# Altium schematic sheet E-Fuse.SchDoc
size A; SheetNumber: 2; SheetTotal: 4
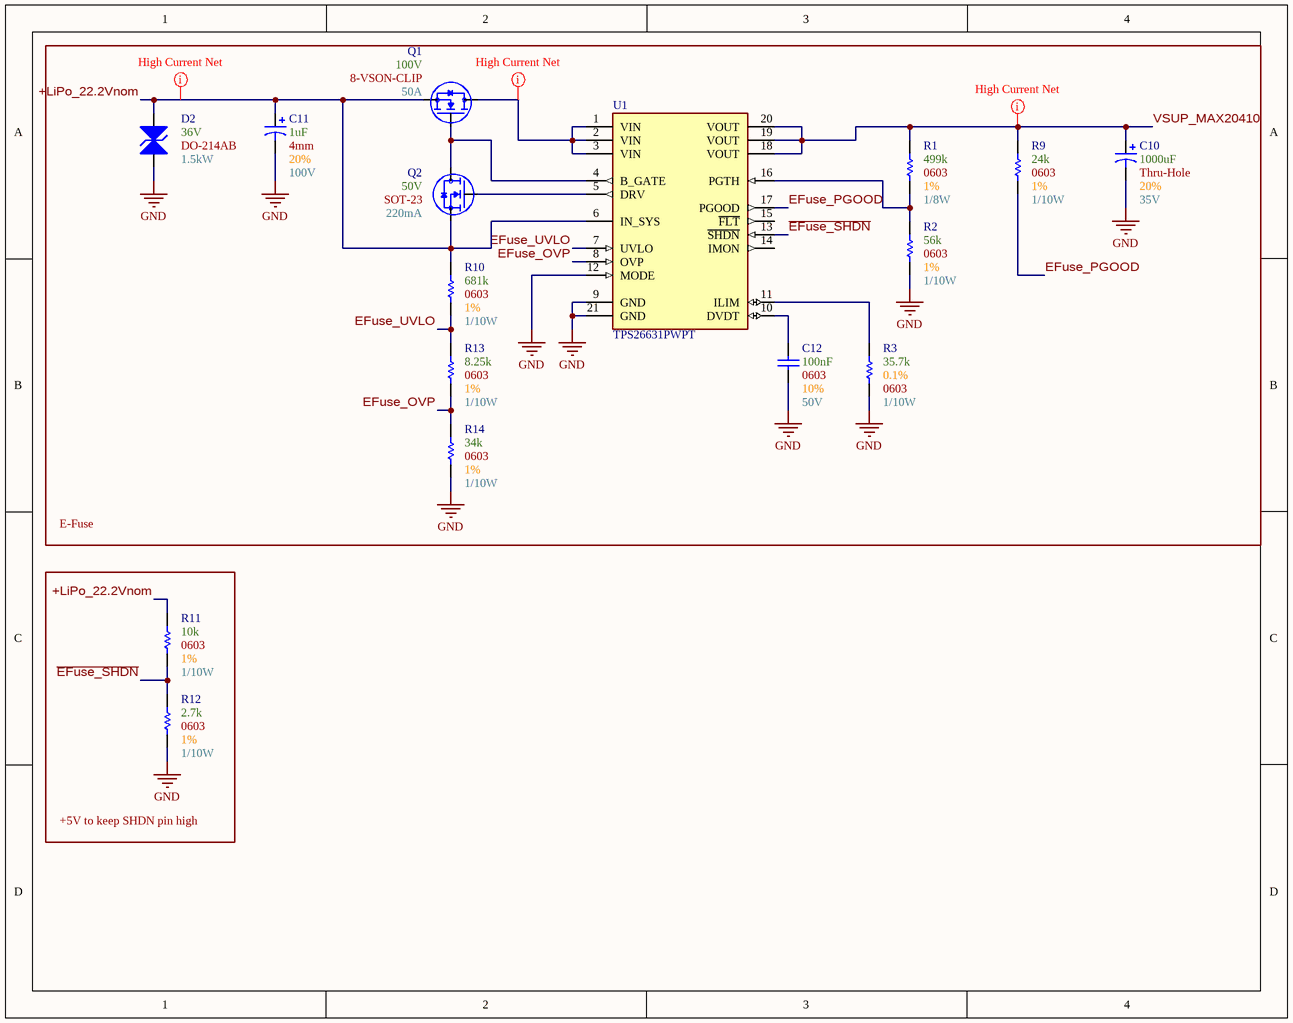
[diagram p0: E-Fuse.SchDoc]

## Parts
C10  Max Voltage: 35V  Size Package: Thru-Hole  Tolerance: 20%  Capacitance: 1000uF  [[Cap] Thru-Hole Polarized 10mm]  (hidden comment: [Cap] Thru-Hole 1000uF 20% 35V)
C11  Max Voltage: 100V  Size Package: 4mm  Tolerance: 20%  Capacitance: 1uF  [[Cap] SMD Polarized, 4mm]  (hidden comment: [Cap] 4mm 1uF 20% 100V)
C12  Max Voltage: 50V  Size Package: 0603  Tolerance: 10%  Capacitance: 100nF  [[Cap] SMD 0603]  (hidden comment: [Cap] 0603 0.1uF 10% 50V)
D2  Wattage: 1.5kW  Optimal Zener Voltage: 36V  [[Diode] SMD DO-214AB]  (hidden comment: DO-214AB)
Q1  IDS_Max: 50A  VDS_Max: 100V  [8-VSON-CLIP]  (hidden comment: CSD19537Q3)
Q2  IDS_Max: 220mA  VDS_Max: 50V  [SOT-23]  (hidden comment: [NMOS] SMD 50V 220mA 3Ohm)
R1  Wattage: 1/8W  Tolerance: 1%  Resistance: 499k  Size Package: 0603  [[Res] SMD 0603]  (hidden comment: [499k] SMD 0603 1% 1/8W)
R2  Wattage: 1/10W  Tolerance: 1%  Resistance: 56k  Size Package: 0603  [[Res] SMD 0603]  (hidden comment: [56k] SMD 0603 1% 1/10W)
R3  Wattage: 1/10W  Tolerance: 0.1%  Resistance: 35.7k  Size Package: 0603  [[Res] SMD 0603]  (hidden comment: [35.7k] SMD 0603 0.1% 1/10W)
R9  Wattage: 1/10W  Tolerance: 1%  Resistance: 24k  Size Package: 0603  [[Res] SMD 0603]  (hidden comment: [24k] SMD 0603 1% 1/10W)
R10  Wattage: 1/10W  Tolerance: 1%  Resistance: 681k  Size Package: 0603  [[Res] SMD 0603]  (hidden comment: [681k] SMD 0603 1% 1/10W)
R11  Wattage: 1/10W  Tolerance: 1%  Resistance: 10k  Size Package: 0603  [[Res] SMD 0603]  (hidden comment: [10k] SMD 0603 1% 1/10W)
R12  Wattage: 1/10W  Tolerance: 1%  Resistance: 2.7k  Size Package: 0603  [[Res] SMD 0603]  (hidden comment: [2.7k] SMD 0603 1% 1/10W)
R13  Wattage: 1/10W  Tolerance: 1%  Resistance: 8.25k  Size Package: 0603  [[Res] SMD 0603]  (hidden comment: [8.25k] SMD 0603 1% 1/10W)
R14  Wattage: 1/10W  Tolerance: 1%  Resistance: 34k  Size Package: 0603  [[Res] SMD 0603]  (hidden comment: [34k] SMD 0603 1% 1/10W)
U1  TPS26631PWPT  [[E-Fuse] 4.5-60V 6A]

## Blocks framed on the sheet
E-Fuse: C10-C12 D2 Q1 Q2 R1-R3 R9 R10 R13 R14 U1
+5V to keep SHDN pin high: R11 R12

## Nets
GND: C10.2 C11.2 C12.1 D2.2(A) R2.1 R3.1 R12.1 R14.1 U1.9(GND) U1.12(MODE) U1.21(GND)
+LiPo_22.2Vnom: C11.1 D2.1(K) Q1.2(Source) Q2.2(Source) R10.2 R11.2 U1.6(IN_SYS)
~{EFuse_SHDN}: R11.1 R12.2 U1.13(~{SHDN})
EFuse_OVP: R13.1 R14.2 U1.8(OVP)
EFuse_PGOOD: R9.1 U1.17(PGOOD)
EFuse_UVLO: R10.1 R13.2 U1.7(UVLO)
VSUP_MAX20410: C10.1 R1.2 R9.2 U1.18(VOUT) U1.19(VOUT) U1.20(VOUT)
NetC12_2: C12.2 U1.10(DVDT)
NetQ1_1: Q1.1(Gate) Q2.3(Drain) U1.4(B_GATE)
NetQ1_3: Q1.3(Drain) U1.1(VIN) U1.2(VIN) U1.3(VIN)
NetQ2_1: Q2.1(Gate) U1.5(DRV)
NetR1_1: R1.1 R2.2 U1.16(PGTH)
NetR3_2: R3.2 U1.11(ILIM)

Not connected (* = marked no-connect by the designer): U1 14(IMON) 15(~{FLT})

## Layout directives
net class High_Current_Nets: +LiPo_22.2Vnom, NetQ1_3, VSUP_MAX20410

## Library data of the parts
C10 = [Cap] Thru-Hole 1000uF 20% 35V: 35PK1000MEFC10X20; Supplier 1: DigiKey; Supplier Part Number 1: 1189-1742-ND
C11 = [Cap] 4mm 1uF 20% 100V: 865080840001; Supplier 1: DigiKey; Supplier Part Number 1: 732-865080840001CT-ND
C12 = [Cap] 0603 0.1uF 10% 50V: CL10B104KB8NNNC; Supplier 1: DigiKey; Supplier Part Number 1: 1276-1000-6-ND
D2 = [TVS] 36Vnom 40Vclamp_max: SMCJ36CA; Supplier 1: DigiKey; Supplier Part Number 1: SMCJ36CALFDKR-ND; Footprint: DO-214AB
Q1 = [NMOS] SMD 100V 50A 14.5mOhm: Supplier 1: DigiKey; Supplier Part Number 1: 296-44351-6-ND; Package: 8-VSON-CLIP
Q2 = [NMOS] SMD 50V 220mA 3Ohm: BSS138; Supplier 1: DigiKey; Supplier Part Number 1: BSS138DKR-ND; Package: SOT-23
R1 = [499k] SMD 0603 1% 1/8W: CRCW0603499KFKEA; Supplier 1: DigiKey; Supplier Part Number 1: 541-499KHDKR-ND
R2 = [56k] SMD 0603 1% 1/10W: CRGCQ0603F56K; Supplier 1: DigiKey; Supplier Part Number 1: A129709CT-ND
R3 = [35.7k] SMD 0603 0.1% 1/10W: RT0603BRE0735K7L; Supplier 1: DigiKey; Supplier Part Number 1: YAG4707CT-ND
R9 = [24k] SMD 0603 1% 1/10W: RC0603FR-1324KL; Supplier 1: DigiKey; Supplier Part Number 1: 13-RC0603FR-1324KLCT-ND
R10 = [681k] SMD 0603 1% 1/10W: RT0603FRE07681KL; Supplier 1: DigiKey; Supplier Part Number 1: 13-RT0603FRE07681KLCT-ND
R11 = [10k] SMD 0603 1% 1/10W: RMCF0603FT10K0; Supplier 1: DigiKey; Supplier Part Number 1: RMCF0603FT10K0DKR-ND
R12 = [2.7k] SMD 0603 1% 1/10W: AC0603FR-072K7L; Supplier 1: DigiKey; Supplier Part Number 1: YAG3589CT-ND
R13 = [8.25k] SMD 0603 1% 1/10W: AF0603FR-078K25L; Supplier 1: DigiKey; Supplier Part Number 1: 13-AF0603FR-078K25LCT-ND
R14 = [34k] SMD 0603 1% 1/10W: RC0603FR-1334KL; Supplier 1: DigiKey; Supplier Part Number 1: 13-RC0603FR-1334KLDKR-ND
U1 = [E-Fuse] 4.5-60V 6A